# Altium schematic sheet ESP32.SchDoc: ESP32
size A4; DocumentNumber: 8; SheetNumber: 9; SheetTotal: 17
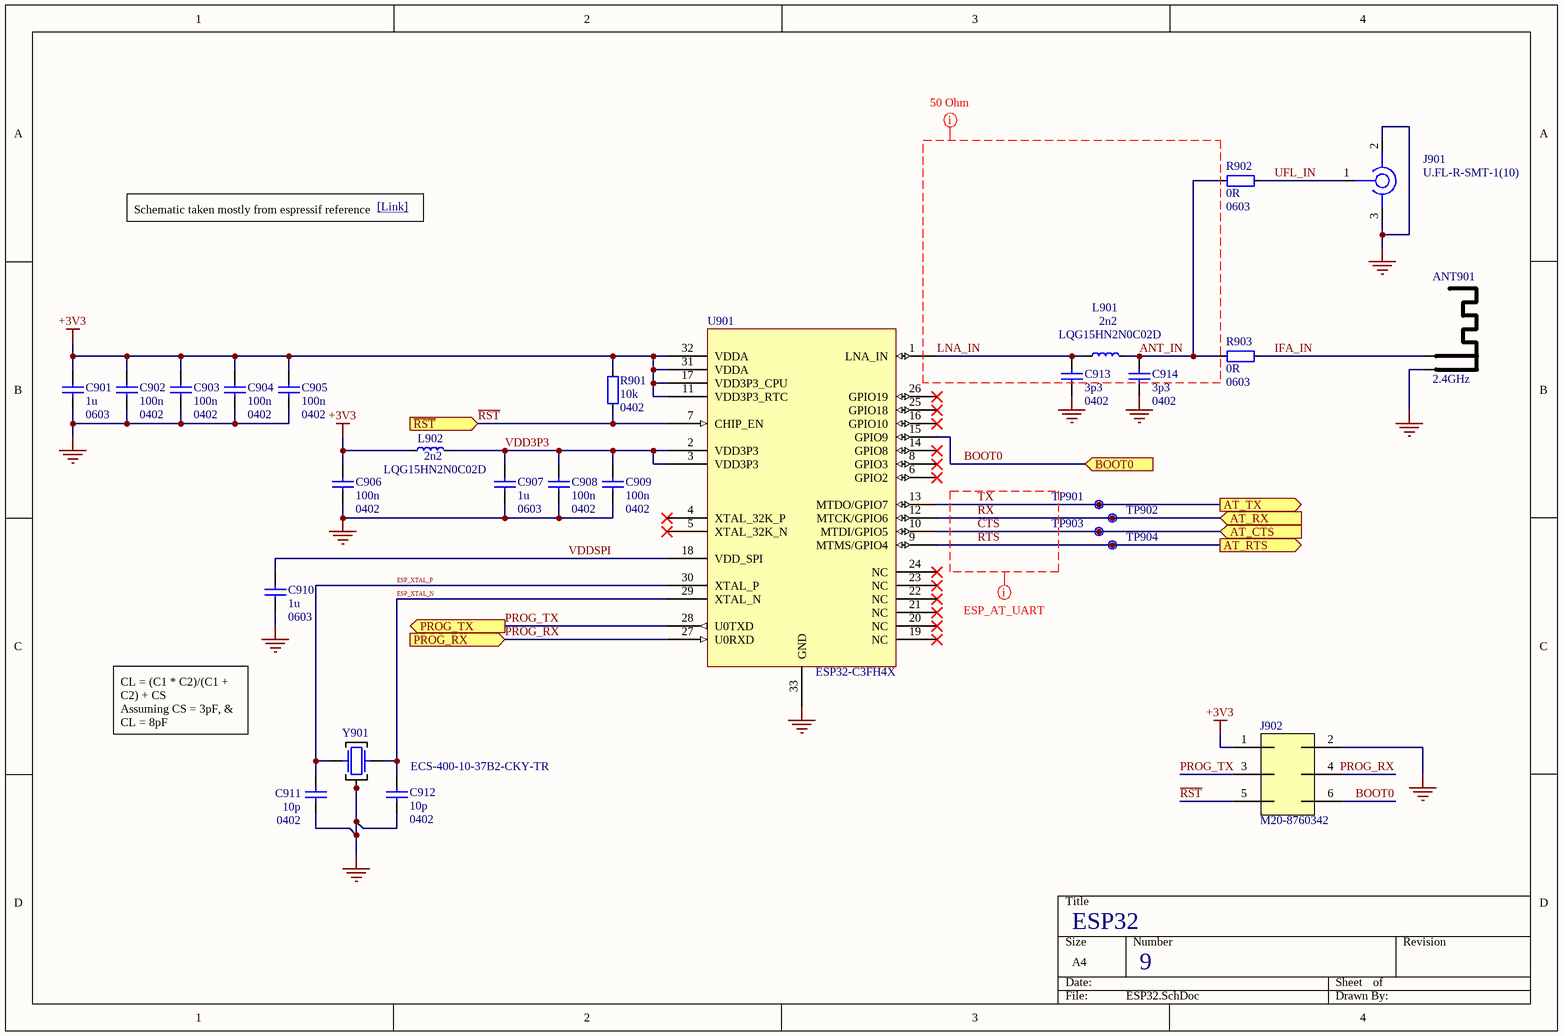
[diagram p0: ESP32.SchDoc]

## Parts
ANT901  2.4GHz  [Meandering_Inverted_F_Antenna]  (net tie, no BOM)
C901  1u  Footprint: 0603  [CAP_0603_B]
C902  100n  Footprint: 0402  [CAP_0402_B]
C903  100n  Footprint: 0402  [CAP_0402_B]
C904  100n  Footprint: 0402  [CAP_0402_B]
C905  100n  Footprint: 0402  [CAP_0402_B]
C906  100n  Footprint: 0402  [CAP_0402_B]
C907  1u  Footprint: 0603  [CAP_0603_B]
C908  100n  Footprint: 0402  [CAP_0402_B]
C909  100n  Footprint: 0402  [CAP_0402_B]
C910  1u  Footprint: 0603  [CAP_0603_B]
C911  10p  Footprint: 0402  [CAP_0402_B]
C912  10p  Footprint: 0402  [CAP_0402_B]
C913  3p3  Footprint: 0402  [CAP_0402_B]
C914  3p3  Footprint: 0402  [CAP_0402_B]
J901  U.FL-R-SMT-1(10)  [U.FL-R-SMT-1(80)]
J902  M20-8760342  [M20-8760342]
L901  2n2  [LQG15HN2N0C02D]
L902  2n2  [LQG15HN2N0C02D]
R901  10k  Footprint: 0402  [RES_0402_A]
R902  0R  Footprint: 0603  [RES_0603_A]
R903  0R  Footprint: 0603  [RES_0603_A]
TP901  Net  [Unlabelled Testpoint]  (value not drawn)
TP902  Net  [Unlabelled Testpoint]  (value not drawn)
TP903  Net  [Unlabelled Testpoint]  (value not drawn)
TP904  Net  [Unlabelled Testpoint]  (value not drawn)
U901  ESP32-C3FH4X  [ESP32-C3FH4X]
Y901  ECS-400-10-37B2-CKY-TR  [ECS-400-10-37B2-CKY-TR]

## Ports
AT_CTS (in, see Top_Level[1D], MCU[3C]), AT_RTS (out, see Top_Level[1D], MCU[3C]), AT_RX (in, see Top_Level[1D], MCU[3D]), AT_TX (out, see Top_Level[1D], MCU[3D]), BOOT0 (in, see Top_Level[1D]), PROG_RX (in, see Top_Level[1D]), PROG_TX (out, see Top_Level[1D]), ~{RST} (in, see Top_Level[1D])

## Nets
+3V3: C901.1 C902.1 C903.1 C904.1 C905.1 C906.1 J902.1 L902.2(a) R901.1(a) U901.11(VDD3P3_RTC) U901.17(VDD3P3_CPU) U901.31(VDDA) U901.32(VDDA)
GND: ANT901.1(GND) C901.2 C902.2 C903.2 C904.2 C905.2 C906.2 C907.2 C908.2 C909.2 C910.2 C911.2 C912.2 C913.2 C914.2 J901.2(GND) J901.3(GND) J902.2 U901.33(GND) Y901.2(GND) Y901.4(GND)
ANT_IN: C914.1 L901.1(a) R902.1(a) R903.1(a)
BOOT0: J902.6 U901.15(GPIO9) ; port BOOT0
CTS: TP903.1 U901.10(MTDI/GPIO5) ; port AT_CTS
ESP_XTAL_N: C912.1 U901.29(XTAL_N) Y901.1(IO)
ESP_XTAL_P: C911.1 U901.30(XTAL_P) Y901.3(IO)
IFA_IN: ANT901.2(FEED) R903.2(a)
LNA_IN: C913.1 L901.2(a) U901.1(LNA_IN)
PROG_RX: J902.4 U901.27(U0RXD) ; port PROG_RX
PROG_TX: J902.3 U901.28(U0TXD) ; port PROG_TX
~{RST}: J902.5 R901.2(a) U901.7(CHIP_EN) ; port ~{RST}
RTS: TP904.1 U901.9(MTMS/GPIO4) ; port AT_RTS
RX: TP902.1 U901.12(MTCK/GPIO6) ; port AT_RX
TX: TP901.1 U901.13(MTDO/GPIO7) ; port AT_TX
UFL_IN: J901.1(SIG) R902.2(a)
VDD3P3: C907.1 C908.1 C909.1 L902.1(a) U901.2(VDD3P3) U901.3(VDD3P3)
VDDSPI: C910.1 U901.18(VDD_SPI)

Not connected (* = marked no-connect by the designer): U901 4(XTAL_32K_P)* 5(XTAL_32K_N)* 6(GPIO2)* 8(GPIO3)* 14(GPIO8)* 16(GPIO10)* 19(NC)* 20(NC)* 21(NC)* 22(NC)* 23(NC)* 24(NC)* 25(GPIO18)* 26(GPIO19)*

## Layout directives
mark named ESP_AT_UART: CTS, RTS, RX, TX
net class 50Ohm: ANT_IN, LNA_IN

## Notes on the sheet
- Schematic taken mostly from espressif reference
- [Link] <https://docs.espressif.com/projects/esp-hardware-design-guidelines/en/latest/esp32c3/schematic-checklist.html>
- CL = (C1 * C2)/(C1 + C2) + CS
  Assuming CS = 3pF, & CL = 8pF
  C2 = C1 = 10pF

## Library data of the parts
ANT901 = Meandering_Inverted_F_Antenna: 2.4GHz meandering inverted F antenna. Taken from Texas Instruments AN043.
C901 C907 C910 = CAP_0603: 0603 SMD Capacitor
C902-C906 C908 C909 C911-C914 = CAP_0402: 0402 SMD Capacitor
J901 = U.FL-R-SMT-1(10): U.FL (UMCC) Connector Receptacle, Male Pin 50 Ohms Surface Mount Solder; Supplier 1: Future Electronics; Supplier Part Number 1: U.FL-R-SMT-1(10)
J902 = M20-8760342: Connector Header Surface Mount 6 position 0.100" (2.54mm); Supplier 1: DigiKey; Supplier Part Number 1: 952-1922-ND
L901 L902 = IND_GENERIC: LQG15HN2N0C02D; Part Number: LQG15HN2N0C02D
R901 = RES_0402: 0402 SMD Resistor
R902 R903 = RES_0603: 0603 SMD Resistor
TP901-TP904 = Unlabelled Testpoint: Symbol for an unlabelled testpoint
U901 = ESP32-C3FH4X: ESP32-C3FH4X IS AN LOW-POWER AND; Supplier 1: DigiKey; Supplier Part Number 1: 1965-ESP32-C3FH4XCT-ND
Y901 = ECS-400-10-37B2-CKY-TR: 40 MHz ±10ppm Crystal 10pF 40 Ohms 4-SMD, No Lead; Supplier 1: Future Electronics; Supplier Part Number 1: ECS-400-10-37B2-CKY-TR